# Altium project Bento Pad V1.0.PrjPcb (part 2 of 2)

## Sheet Controller_Sheet.SchDoc
size A4; SheetNumber: 2; SheetTotal: 3
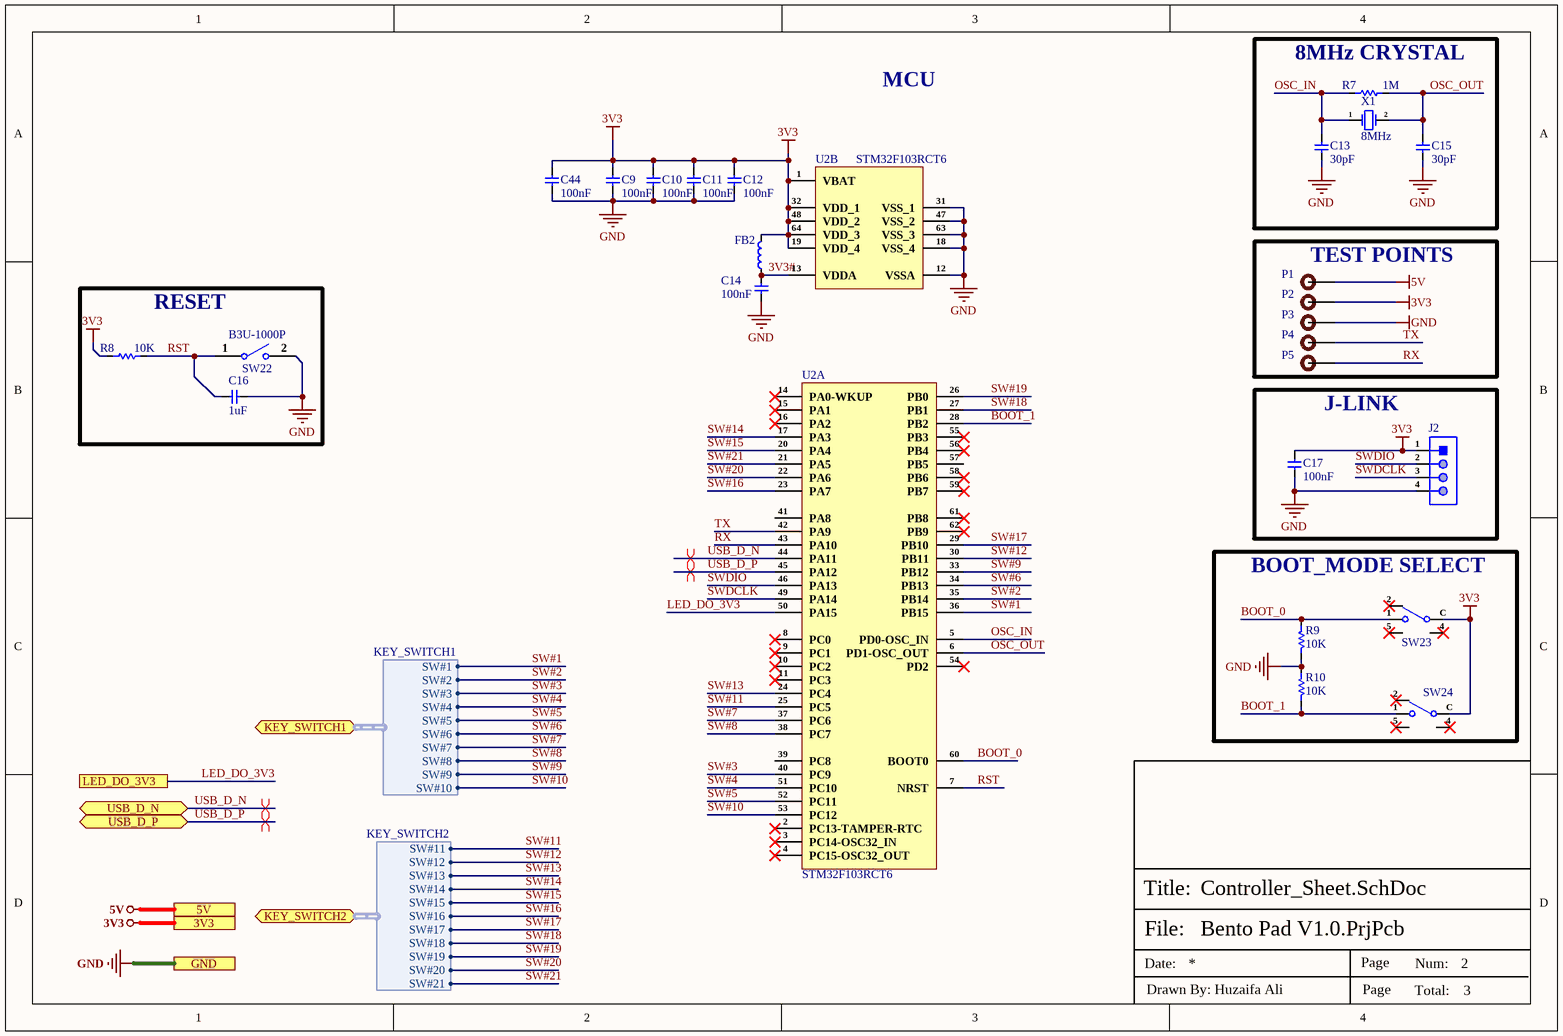
[diagram p1: Controller_Sheet.SchDoc]

### Parts
C9  100nF  [cap-0402]
C10  100nF  [cap-0402]
C11  100nF  [cap-0402]
C12  100nF  [cap-0402]
C13  30pF  [Cap-0402]
C14  100nF  [cap-0402]
C15  30pF  [Cap-0402]
C16  1uF  [Cap-0402]
C17  100nF  [cap-0402]
C44  100nF  [cap-0402]
FB2  MMZ2012R102ATD25  [Ind-0805]  (value not drawn)
J2  X6511WV-04H-C60D30  [HDR1X4_]  (value not drawn)
P1  TEST POINT  [Test-point]  (value not drawn)
P2  TEST POINT  [Test-point]  (value not drawn)
P3  TEST POINT  [Test-point]  (value not drawn)
P4  TEST POINT  [Test-point]  (value not drawn)
P5  TEST POINT  [Test-point]  (value not drawn)
R7  1M  [Res-0402]
R8  10K  [Res-0402]
R9  10K  [Res-0402]
R10  10K  [Res-0402]
SW22  B3U-1000P  [B3U-1000P]
SW23  MK-11C04-G013  [MK-11C04-G013]  (value not drawn)
SW24  MK-11C04-G013  [MK-11C04-G013]  (value not drawn)
U2  STM32F103RCT6  [64-LQFP (10x10)]  (parts A,B of 2)
X1  8MHz  [HC-49S-SMD]

### Blocks framed on the sheet
8MHz CRYSTAL: C13 C15 R7 X1
TEST POINTS: P1-P5
RESET: C16 R8 SW22
J-LINK: C17 J2
BOOT_MODE SELECT: R9 R10 SW23 SW24

### Ports
3V3, 5V, GND, KEY_SWITCH1 (bidir, harness KEY_SWITCH1), KEY_SWITCH2 (bidir, harness KEY_SWITCH2), LED_DO_3V3, USB_D_N (bidir), USB_D_P (bidir)

### Harnesses
KEY_SWITCH2: SW#11, SW#12, SW#13, SW#14, SW#15, SW#16, SW#17, SW#18, SW#19, SW#20, SW#21
KEY_SWITCH1: SW#1, SW#2, SW#3, SW#4, SW#5, SW#6, SW#7, SW#8, SW#9, SW#10

### Nets
3V3: C9.1 C10.1 C11.1 C12.1 C17.2 C44.1 FB2.2 J2.1 P2.1 R8.2 SW23.C SW24.C U2.1(VBAT) U2.19(VDD_4) U2.32(VDD_1) U2.48(VDD_2) U2.64(VDD_3) ; port 3V3
5V: P1.1 ; port 5V
GND: C9.2 C10.2 C11.2 C12.2 C13.1 C14.2 C15.1 C16.2 C17.1 C44.2 J2.4 P3.1 R9.2 R10.1 SW22.2 U2.12(VSSA) U2.18(VSS_4) U2.31(VSS_1) U2.47(VSS_2) U2.63(VSS_3) ; port GND
3V3#: C14.1 FB2.1 U2.13(VDDA)
BOOT_0: R9.1 SW23.1 U2.60(BOOT0)
BOOT_1: R10.2 SW24.1 U2.28(PB2)
LED_DO_3V3: U2.50(PA15) ; port LED_DO_3V3
OSC_IN: C13.2 R7.1 U2.5(PD0-OSC_IN) X1.1(OSC1)
OSC_OUT: C15.2 R7.2 U2.6(PD1-OSC_OUT) X1.2(OSC2)
RST: C16.1 R8.1 SW22.1 U2.7(NRST)
RX: P5.1 U2.43(PA10)
SW#1: U2.36(PB15) ; port KEY_SWITCH1.SW#1
SW#2: U2.35(PB14) ; port KEY_SWITCH1.SW#2
SW#3: U2.40(PC9) ; port KEY_SWITCH1.SW#3
SW#4: U2.51(PC10) ; port KEY_SWITCH1.SW#4
SW#5: U2.52(PC11) ; port KEY_SWITCH1.SW#5
SW#6: U2.34(PB13) ; port KEY_SWITCH1.SW#6
SW#7: U2.37(PC6) ; port KEY_SWITCH1.SW#7
SW#8: U2.38(PC7) ; port KEY_SWITCH1.SW#8
SW#9: U2.33(PB12) ; port KEY_SWITCH1.SW#9
SW#10: U2.53(PC12) ; port KEY_SWITCH1.SW#10
SW#11: U2.25(PC5) ; port KEY_SWITCH2.SW#11
SW#12: U2.30(PB11) ; port KEY_SWITCH2.SW#12
SW#13: U2.24(PC4) ; port KEY_SWITCH2.SW#13
SW#14: U2.17(PA3) ; port KEY_SWITCH2.SW#14
SW#15: U2.20(PA4) ; port KEY_SWITCH2.SW#15
SW#16: U2.23(PA7) ; port KEY_SWITCH2.SW#16
SW#17: U2.29(PB10) ; port KEY_SWITCH2.SW#17
SW#18: U2.27(PB1) ; port KEY_SWITCH2.SW#18
SW#19: U2.26(PB0) ; port KEY_SWITCH2.SW#19
SW#20: U2.22(PA6) ; port KEY_SWITCH2.SW#20
SW#21: U2.21(PA5) ; port KEY_SWITCH2.SW#21
SWDCLK: J2.3 U2.49(PA14)
SWDIO: J2.2 U2.46(PA13)
TX: P4.1 U2.42(PA9)
USB_D_N: U2.44(PA11) ; port USB_D_N
USB_D_P: U2.45(PA12) ; port USB_D_P

Not connected (* = marked no-connect by the designer): SW23 2* 4(MP)* 5(MP)*; SW24 2* 4(MP)* 5(MP)*; U2 2(PC13-TAMPER-RTC)* 3(PC14-OSC32_IN)* 4(PC15-OSC32_OUT)* 8(PC0)* 9(PC1)* 10(PC2)* 11(PC3)* 14(PA0-WKUP)* 15(PA1)* 16(PA2)* 39(PC8) 41(PA8) 54(PD2)* 55(PB3)* 56(PB4)* 57(PB5) 58(PB6)* 59(PB7)* 61(PB8)* 62(PB9)*

### Layout directives
differential pair; net class USB; differential pair class USB_Lines; rule Impedance Constraint [Min = 85.00    Max = 90.00    ]; rule Matched Net Lengths [Tolerance = 50mil]: USB_D_N, USB_D_P

### Notes on the sheet
- MCU
- File:
- Title:
- Date:
- Page
- Num:
- Total:
- Drawn By: Huzaifa Ali

### Library data of the parts
C9-C12 C14 C17 C44 = C1005X7R1H104KT000F: CAP CER 0.1UF 50V X7R 0402; Manufacturer: TDK; Tolerance: 10%; Voltage: 25V; Item Type: Capacitor; Supplier 1: Avnet; Manufacturer Part Number: C1005X7R1H104KT000F; RoHS: No; Category: Ceramic Capacitors; Dielectric: X7R; Supplier Part Number 1: C1005X7R1H104KT000F; LCSC Part Number: C361198; ComponentLink1Description: LCSC; ComponentLink1URL: https://www.lcsc.com/product-detail/Multilayer-Ceramic-Capacitors-MLCC-SMD-SMT_TDK-C1005X7R1H104KT000F_C361198.html
C13 C15 = CC0402GRNPO9BN300: CAP CER 30PF 50V C0G/NPO 0402; Manufacturer: Yageo; Item Type: Capacitor; Tolerance: 2%; Dielectric: C0G; Supplier: Digikey; LCSC Part Number: C277479; Manufacturer Part Number: CC0402GRNPO9BN300; RoHS: Yes; Stock: 114930; Pricing: 1=0.1, 10=0.052, 50=0.0296, 100=0.023, 500=0.01728, 1000=0.01358, 2500=0.01235, 5000=0.01136 (USD); Mounting Technology: Surface Mount; Case/Package: 0402; Case Code (Imperial): 0402; Case Code (Metric): 1005; Weight: 2.3E-05oz; Min Operating Temperature: -55°C; Max Operating Temperature: 125°C; Value: 30pF; Voltage Rating (DC): 50V; Packaging: Tape and Reel; Termination: SMD/SMT; Voltage Rating: 50V; Series: CC; Length: 0.039inch; Width: 0.02inch; Thickness: 0.022inch; Halogen Free: 5694HalogenFree; Lead Free: 5697LeadFree; ComponentLink1URL: https://datasheet.ciiva.com/13263/upy-gp-np0-16v-to-50v-8-3714-13263350.pdf?src-supplier=Mouser; ComponentLink1Description: https://datasheet.ciiva.com/13263/upy-gp-np0-16v-to-50v-8-3714-13263350.pdf?src-supplier=Mouser
C16 = C1005X5R1V105K050BC: CAP CER 1UF 35V X5R 0402; Manufacturer: TDK; Item Type: Capacitors; Dielectric Material: Ceramic; Material: 4241ConductorMaterial; Tolerance: 10%; Supplier: Digikey; Supplier Part Number: 445-9073-1-ND; Manufacturer Part Number: C1005X5R1V105K050BC; RoHS: Yes; Stock: 682645; Pricing: 1=0.15, 10=0.087, 50=0.061, 100=0.0528, 500=0.03898, 1000=0.03468, 2500=0.03011, 5000=0.02735 (USD); Mounting Technology: Surface Mount; Case/Package: 0402; Case Code (Metric): 1005; Case Code (Imperial): 0402; Min Operating Temperature: -55°C; Max Operating Temperature: 85°C; Value: 1uF; Voltage Rating: 35V; Packaging: Tape and Reel; Dielectric: X5R; Series: C; Length: 1mm; Depth: 0.5mm; Radiation Hardening: No; Reach SVHC Compliant: No; Lead Free: Lead Free; RoHS Compliant: Yes; ComponentLink1URL: https://datasheet.ciiva.com/26834/getdatasheetpartid-750449-26834298.pdf?src-supplier=Verical; ComponentLink1Description: https://datasheet.ciiva.com/26834/getdatasheetpartid-750449-26834298.pdf?src-supplier=Verical; ComponentLink2URL: https://datasheet.ciiva.com/28451/1796654-28451087.pdf?src-supplier=Element14; ComponentLink2Description: https://datasheet.ciiva.com/28451/1796654-28451087.pdf?src-supplier=Element14; ComponentLink3URL: https://datasheet.ciiva.com/22719/1796654-22719533.pdf?src-supplier=Element14; ComponentLink3Description: https://datasheet.ciiva.com/22719/1796654-22719533.pdf?src-supplier=Element14
FB2 = MMZ2012R102ATD25: FERRITE BEAD 1K OHM 0805 1LN; Manufacturer: TDK; Number of Lines: 1; Max Current Rating: 500mA; DC Resistance (DCR): 300mR; Impedance: 1kR; Tolerance: 25%; Test Frequency: 100MHz; Supplier 1: Digi-Key; Manufacturer Part Number: MMZ2012R102ATD25; RoHS: Yes; Category: Ferrite Beads and Chips; Stock 1: 2942; Pricing 1: 1=0.11000, 10=0.09200, 25=0.08280, 50=0.06080, 100=0.05240, 250=0.04140, 500=0.03496, 1000=0.02944 (USD); Mount: Surface Mount; Case/Package: 0805; Case Code (Metric): 2012; Case Code (Imperial): 0805; Weight: 0.000194oz; Min Operating Temperature: -55°C; Max Operating Temperature: 125°C; Package Quantity: 4000; Packaging: Tape and Reel; Termination: SMD/SMT; Max DC Current: 500mA; Length: 0.079inch; Width: 0.049inch; Height: 0.041inch; Ratings: AEC-Q200; RoHS Compliant: Yes; ComponentLink1URL: http://www.mouser.com/ds/2/400/beads_automotive_signal_mmz_en-469244.pdf?src-supplier=Mouser; ComponentLink1Description: http://www.mouser.com/ds/2/400/beads_automotive_signal_mmz_en-469244.pdf?src-supplier=Mouser; ComponentLink2URL: https://product.tdk.com/info/en/catalog/datasheets/beads_automotive_signal_mmz2012_en.pdf?src-supplier=Digi-Key; ComponentLink2Description: https://product.tdk.com/info/en/catalog/datasheets/beads_automotive_signal_mmz2012_en.pdf?src-supplier=Digi-Key; Supplier Part Number 1: 445-MMZ2012R102ATD25CT-ND; LCSC Part Number: C307765; Item Type: Ferrite Bead
J2 = X6511WV-04H-C60D30: Gold 250V 3A Straight Square Pins 2.5mm 4P 260℃ 6mm -40℃~+105℃ 3mm 2.54mm Plugin Black Brass 1x4P Plugin,P=2.54mm Pin Headers ROHS; Manufacturer: XKB; Item Type: Male Header; ComponentLink1Description: LCSC; ComponentLink1URL: https://www.lcsc.com/product-detail/Pin-Headers_XKB-Connectivity-X6511WV-04H-C60D30_C706876.html; Manufacturer Part Number: X6511WV-04H-C60D30; Package: Plugin,P=2.54mm; LCSC Part Number: C706876
P1-P5 = TEST POINT: Test Point ON; Item Type: TEST POINT
R7 = RC0402FR-071ML: RES 1M OHM 1% 1/16W 0402; Manufacturer: Yageo; Value: 1MR; Power Rating: 63mW; Voltage Rating: 50V; Temperature Coefficient: 100ppm/°C; Item Type: Resistor; Supplier: Digikey; Supplier Part Number: 311-1.00MLRCT-ND; Manufacturer Part Number: RC0402FR-071ML; RoHS: Yes; Category: Chip SMD Resistors; Stock: 6516; Pricing: 1=0.1, 10=0.015, 50=0.0088, 100=0.0073, 500=0.00488, 1000=0.00417, 5000=0.00297 (USD); Case/Package: 0402; Case Code (Imperial): 0402; Case Code (Metric): 1005; Min Operating Temperature: -55°C; Max Operating Temperature: 155°C; Resistor Type: Thick Film; Packaging: Tape and Reel; Tolerance: 1%; Termination: SMD/SMT; Features: Moisture Resistant; Series: RC; Max Power Dissipation: 63mW; Number of Terminations: 2; Resistance Tolerance: 1%; Construction: Rectangular; Technology: THICK FILM; Voltage Rating (AC): 50V; Length: 1mm; Height: 0.32mm; Depth: 0.5mm; RoHS Compliant: Yes; Military Standard: Not; Reach SVHC Compliant: Unknown; Lead Free: 5697LeadFree; ComponentLink1URL: https://datasheet.ciiva.com/11808/0900766b80c66297-11808125.pdf?src-supplier=Rs; ComponentLink1Description: https://datasheet.ciiva.com/11808/0900766b80c66297-11808125.pdf?src-supplier=Rs; ComponentLink2URL: https://datasheet.ciiva.com/46394/1018594-46394951.pdf?src-supplier=Element14; ComponentLink2Description: https://datasheet.ciiva.com/46394/1018594-46394951.pdf?src-supplier=Element14; ComponentLink3URL: https://datasheet.ciiva.com/7849/1018594-7849883.pdf?src-supplier=Element14; ComponentLink3Description: https://datasheet.ciiva.com/7849/1018594-7849883.pdf?src-supplier=Element14; ComponentLink4URL: https://datasheet.ciiva.com/7849/1018594-7849882.pdf?src-supplier=Element14; ComponentLink4Description: https://datasheet.ciiva.com/7849/1018594-7849882.pdf?src-supplier=Element14; ComponentLink5URL: https://datasheet.ciiva.com/16741/pyu-rc0402-51-rohs-l-6-r-16741081.pdf?src-supplier=Future+Electronics; ComponentLink5Description: https://datasheet.ciiva.com/16741/pyu-rc0402-51-rohs-l-6-r-16741081.pdf?src-supplier=Future+Electronics; LCSC Part Number: C138033
R8-R10 = RC0402FR-0710KL: RES 10K OHM 1% 1/16W 0402; Manufacturer: Yageo; Resistance: 10kR; Voltage Rating (DC): 50V; Temperature Coefficient: 100ppm/°C; Power Rating: 62.5mW; Max Power Dissipation: 63mW; Item Type: Resistor; Supplier 1: Mouser; Manufacturer Part Number: RC0402FR-0710KL; RoHS: Yes; Category: Chip SMD Resistors; Stock 1: 18648329; Pricing 1: 1=0.10000, 10=0.01400, 50=0.01400, 100=0.00500, 1000=0.00300, 10000=0.00200 (USD); Case/Package: 0402; Number of Pins: 2; Case Code (Imperial): 0402; Case Code (Metric): 1005; Min Operating Temperature: -55°C; Max Operating Temperature: 155°C; Resistor Type: Thick Film; Tolerance: 1%; Packaging: Tape and Reel; Voltage Rating: 50V; Termination: SMD/SMT; Working Voltage: 50V; Number of Terminations: 2; Features: Moisture Resistant; Series: RC; Resistance Tolerance: 1%; Construction: Rectangular; Length: 1mm; Width: 0.5mm; Height: 0.32mm; Depth: 0.5mm; Lead Pitch: 0.2mm; REACH SVHC: No SVHC; Lead Free: Lead Free; RoHS Compliant: Yes; Military Standard: Not; ComponentLink1URL: https://datasheet.ciiva.com/7660/38568-7660787.pdf?src-supplier=Element14; ComponentLink1Description: https://datasheet.ciiva.com/7660/38568-7660787.pdf?src-supplier=Element14; ComponentLink2URL: https://datasheet.ciiva.com/7849/1686128-7849814.pdf?src-supplier=Element14; ComponentLink2Description: https://datasheet.ciiva.com/7849/1686128-7849814.pdf?src-supplier=Element14; ComponentLink3URL: https://datasheet.ciiva.com/7983/1018594-7983486.pdf?src-supplier=Element14; ComponentLink3Description: https://datasheet.ciiva.com/7983/1018594-7983486.pdf?src-supplier=Element14; ComponentLink4URL: https://datasheet.ciiva.com/22747/1018594-22747512.pdf?src-supplier=Element14; ComponentLink4Description: https://datasheet.ciiva.com/22747/1018594-22747512.pdf?src-supplier=Element14; ComponentLink5URL: https://datasheet.ciiva.com/12667/pyu-rc0402-51-rohs-l-6-r-12667067.pdf?src-supplier=Mouser; ComponentLink5Description: https://datasheet.ciiva.com/12667/pyu-rc0402-51-rohs-l-6-r-12667067.pdf?src-supplier=Mouser; ComponentLink6URL: https://datasheet.ciiva.com/7849/1784430-7849813.pdf?src-supplier=Element14; ComponentLink6Description: https://datasheet.ciiva.com/7849/1784430-7849813.pdf?src-supplier=Element14; ComponentLink7URL: https://datasheet.ciiva.com/7849/1784430-7849815.pdf?src-supplier=Element14; ComponentLink7Description: https://datasheet.ciiva.com/7849/1784430-7849815.pdf?src-supplier=Element14; Supplier Part Number 1: 603-RC0402FR-0710KL; LCSC Part Number: C60490
SW22 = B3U-1000P: SWITCH TACTILE SPST-NO 0.05A 12V; Manufacturer: Omron; Mechanical Life: 200000Cycles; Operating Force: 1.5N; Throw Configuration: SPST; Current Rating: 50mA; Contact Resistance: 100mR; Illumination Type: Non-Illuminated,Illuminated; Switch Travel: 0.15mm; Switch Function: Off-Mom; Actuator Type: Standard; Actuator Length: 0.4mm; Ratings: Dust Proof,IP40; ComponentLink1URL: http://www.farnell.com/datasheets/60838.pdf?src-supplier=Farnell; ComponentLink1Description: http://www.farnell.com/datasheets/60838.pdf?src-supplier=Farnell; ComponentLink2URL: http://www.farnell.com/datasheets/60838.pdf?src-supplier=Element14; ComponentLink2Description: http://www.farnell.com/datasheets/60838.pdf?src-supplier=Element14; ComponentLink3URL: https://omronfs.omron.com/en_US/ecb/products/pdf/en-b3u.pdf?src-supplier=Digi-Key; ComponentLink3Description: https://omronfs.omron.com/en_US/ecb/products/pdf/en-b3u.pdf?src-supplier=Digi-Key; ComponentLink4URL: http://www.omron.com/ecb/products/pdf/en-b3u.pdf?src-supplier=Digi-Key; ComponentLink4Description: http://www.omron.com/ecb/products/pdf/en-b3u.pdf?src-supplier=Digi-Key; ComponentLink5URL: https://www.distrelec.biz/Web/Downloads/he/et/B3U_eng_datasheet.pdf?mime=application%2Fpdf&src-supplier=Distrelec; ComponentLink5Description: https://www.distrelec.biz/Web/Downloads/he/et/B3U_eng_datasheet.pdf?mime=application%2Fpdf&src-supplier=Distrelec; ComponentLink6URL: http://www.onlinecomponents.com/productFiles/mf-OM/en-b3u.pdf?src-supplier=Onlinecomponents.com; ComponentLink6Description: http://www.onlinecomponents.com/productFiles/mf-OM/en-b3u.pdf?src-supplier=Onlinecomponents.com; Supplier 1: Digi-Key; Manufacturer Part Number: B3U-1000P; Stock 1: 116454; Pricing 1: 1=1, 10=0.961, 25=0.9064, 50=0.7976, 100=0.7251, 250=0.68888, 500=0.67074, 1000=0.52571 (USD); Mount: Surface Mount; Weight: 0.000776oz; Contact Material: Silver; Min Operating Temperature: -25°C; Max Operating Temperature: 70°C; Packaging: Tape and Reel; Voltage Rating (DC): 12V; Package Quantity: 1; Max Current Rating: 50mA; Termination: SMD/SMT; Orientation: Straight; Max Voltage Rating (DC): 12V; Electrical Life: 200000Cycles; Insulation Resistance: 100MR; Contact Current Rating: 50mA; Length: 4mm; Height: 1.2mm; Depth: 2.5mm; Width: 3mm; REACH SVHC: Unknown; Lead Free: Lead Free; ComponentLink7URL: https://www.verical.com/server-webapp/html/getDatasheet?partID=552554&src-supplier=Verical; ComponentLink7Description: https://www.verical.com/server-webapp/html/getDatasheet?partID=552554&src-supplier=Verical; ComponentLink8URL: http://www.farnell.com/datasheets/1685550.pdf?src-supplier=Element14; ComponentLink8Description: http://www.farnell.com/datasheets/1685550.pdf?src-supplier=Element14; ComponentLink9URL: http://www.farnell.com/datasheets/2610940.pdf?src-supplier=Farnell; ComponentLink9Description: http://www.farnell.com/datasheets/2610940.pdf?src-supplier=Farnell; ComponentLink10URL: https://www.alliedelec.com/m/d/4c8a9ef82804fc3c241a13c1e298fd73.pdf?src-supplier=Allied+Electronics; ComponentLink10Description: https://www.alliedelec.com/m/d/4c8a9ef82804fc3c241a13c1e298fd73.pdf?src-supplier=Allied+Electronics; Supplier Part Number 1: SW1020DKR-ND; LCSC Part Number: C231329; Item Type: Switch
SW23 SW24 = MK-11C04-G013: Surface Mount 1A SPDT 6V Black 10000次 SMD Slide Switches ROHS; Manufacturer: G-Switch; Manufacturer Part Number: MK-11C04-G013; Package: SMD; LCSC Part Number: C778185; Item Type: Slide Switche; ComponentLink1Description: LCSC; ComponentLink1URL: https://www.lcsc.com/product-detail/Slide-Switches_G-Switch-MK-11C04-G013_C778185.html
U2 = STM32F103RCT6: IC MCU 32BIT 256KB FLASH 64LQFP; Manufacturer: STMicroelectronics; Interface: I2C,SPI,USB,CAN,USART; RAM Size: 48KB; Max Supply Voltage: 3.6V; Number of I/Os: 51; Number of Timers/Counters: 8; Min Supply Voltage: 2V; Data Bus Width: 32b; Clock Frequency: 72MHz; Core Architecture: ARM; Number of ADC Channels: 16; Supplier 1: Mouser; Manufacturer Part Number: STM32F103RCT6; RoHS: Yes; Category: Microcontrollers; Stock 1: 44788; Pricing 1: 1=9.74000, 10=8.79000, 50=8.38000, 100=7.28000, 1000=5.58000, 10000=5.58000 (USD); Case/Package: LQFP; Pins: 64; Weight: 0.012088oz; Min Operating Temperature: -40°C; Max Operating Temperature: 85°C; Package Quantity: 960; Packaging: Tray; Memory Format: FLASH; Memory Size: 256KB; Series: STM32F103RC; Length: 10mm; Width: 10mm; Height: 1.4mm; Lead Free: Lead Free; RoHS Compliant: Yes; ComponentLink1URL: https://datasheet.ciiva.com/4845/cd00191185-4845648.pdf?src-supplier=Mouser; ComponentLink1Description: https://datasheet.ciiva.com/4845/cd00191185-4845648.pdf?src-supplier=Mouser; ComponentLink2URL: https://datasheet.ciiva.com/8054/1831497-8054949.pdf?src-supplier=Element14; ComponentLink2Description: https://datasheet.ciiva.com/8054/1831497-8054949.pdf?src-supplier=Element14; ComponentLink3URL: https://datasheet.ciiva.com/5752/cd00191185-5752853.pdf?src-supplier=Farnell; ComponentLink3Description: https://datasheet.ciiva.com/5752/cd00191185-5752853.pdf?src-supplier=Farnell; ComponentLink4URL: https://datasheet.ciiva.com/9224/cd00191185-9224408.pdf?src-supplier=Avnet; ComponentLink4Description: https://datasheet.ciiva.com/9224/cd00191185-9224408.pdf?src-supplier=Avnet; ComponentLink5URL: https://datasheet.ciiva.com/16382/cd00191185-16382444.pdf?src-supplier=Future+Electronics; ComponentLink5Description: https://datasheet.ciiva.com/16382/cd00191185-16382444.pdf?src-supplier=Future+Electronics; Supplier Part Number 1: 511-STM32F103RCT6; LCSC Part Number: C8323; Item Type: IC
X1 = TAXM8M2GLFBET2T: 8MHz Surface Mount Crystal 20pF ±30ppm ±30ppm HC-49S-SMD Crystals ROHS; Manufacturer: Yajingxin; Manufacturer Part Number: TAXM8M2GLFBET2T; Package: HC-49S-SMD; LCSC Part Number: C107426; Item Type: Crystal; ComponentLink1Description: LCSC; ComponentLink1URL: https://www.lcsc.com/product-detail/SMD-Crystal-Resonators_TAE-Zhejiang-Abel-Elec-HC-49SM8MHz20pF30ppm_C107426.html

## Sheet Button_Sheet.SchDoc
size 420 x 297 mm; SheetNumber: 3; SheetTotal: 3
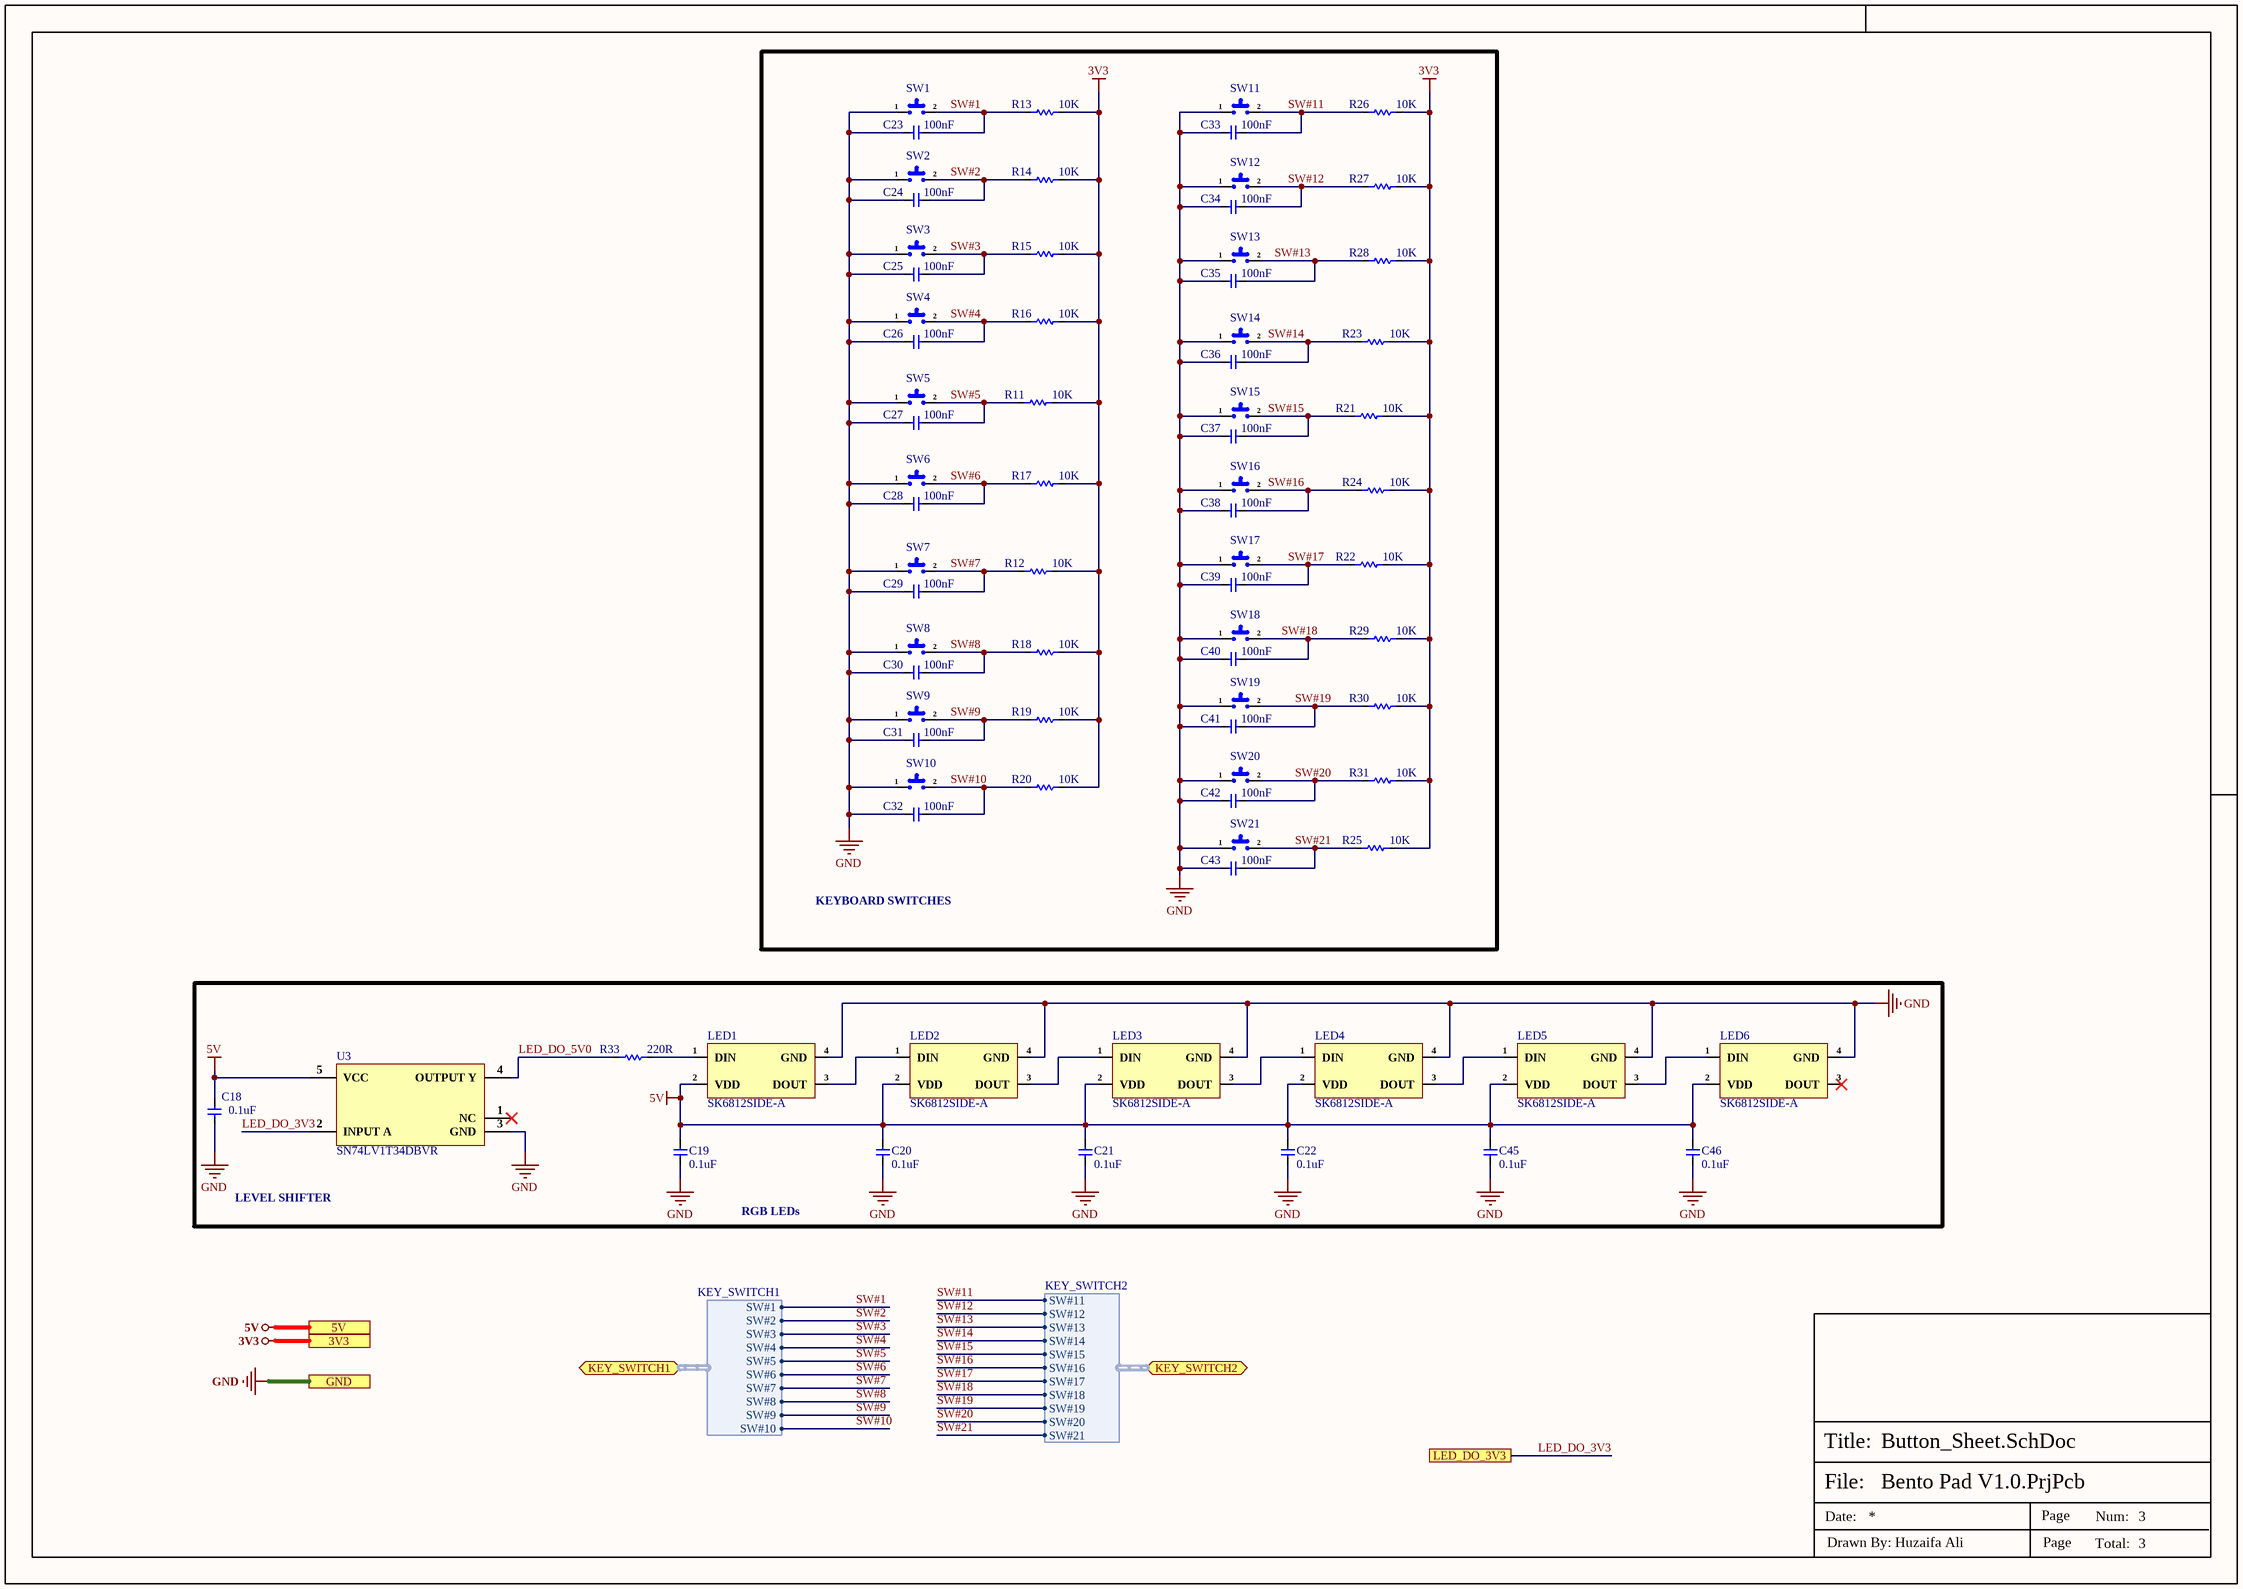
[diagram p2: Button_Sheet.SchDoc]

### Parts
C18  0.1uF  [Cap-0402]
C19  0.1uF  [Cap-0402]
C20  0.1uF  [Cap-0402]
C21  0.1uF  [Cap-0402]
C22  0.1uF  [Cap-0402]
C23  100nF  [cap-0402]
C24  100nF  [cap-0402]
C25  100nF  [cap-0402]
C26  100nF  [cap-0402]
C27  100nF  [cap-0402]
C28  100nF  [cap-0402]
C29  100nF  [cap-0402]
C30  100nF  [cap-0402]
C31  100nF  [cap-0402]
C32  100nF  [cap-0402]
C33  100nF  [cap-0402]
C34  100nF  [cap-0402]
C35  100nF  [cap-0402]
C36  100nF  [cap-0402]
C37  100nF  [cap-0402]
C38  100nF  [cap-0402]
C39  100nF  [cap-0402]
C40  100nF  [cap-0402]
C41  100nF  [cap-0402]
C42  100nF  [cap-0402]
C43  100nF  [cap-0402]
C45  0.1uF  [Cap-0402]
C46  0.1uF  [Cap-0402]
LED1  SK6812SIDE-A  [SK6812SIDE-A]
LED2  SK6812SIDE-A  [SK6812SIDE-A]
LED3  SK6812SIDE-A  [SK6812SIDE-A]
LED4  SK6812SIDE-A  [SK6812SIDE-A]
LED5  SK6812SIDE-A  [SK6812SIDE-A]
LED6  SK6812SIDE-A  [SK6812SIDE-A]
R11  10K  [Res-0402]
R12  10K  [Res-0402]
R13  10K  [Res-0402]
R14  10K  [Res-0402]
R15  10K  [Res-0402]
R16  10K  [Res-0402]
R17  10K  [Res-0402]
R18  10K  [Res-0402]
R19  10K  [Res-0402]
R20  10K  [Res-0402]
R21  10K  [Res-0402]
R22  10K  [Res-0402]
R23  10K  [Res-0402]
R24  10K  [Res-0402]
R25  10K  [Res-0402]
R26  10K  [Res-0402]
R27  10K  [Res-0402]
R28  10K  [Res-0402]
R29  10K  [Res-0402]
R30  10K  [Res-0402]
R31  10K  [Res-0402]
R33  220R  [Res-0603]
SW1  CPG151101S11-16  [CPG151101S11-16]  (value not drawn)
SW2  CPG151101S11-16  [CPG151101S11-16]  (value not drawn)
SW3  CPG151101S11-16  [CPG151101S11-16]  (value not drawn)
SW4  CPG151101S11-16  [CPG151101S11-16]  (value not drawn)
SW5  CPG151101S11-16  [CPG151101S11-16]  (value not drawn)
SW6  CPG151101S11-16  [CPG151101S11-16]  (value not drawn)
SW7  CPG151101S11-16  [CPG151101S11-16]  (value not drawn)
SW8  CPG151101S11-16  [CPG151101S11-16]  (value not drawn)
SW9  CPG151101S11-16  [CPG151101S11-16]  (value not drawn)
SW10  CPG151101S11-16  [CPG151101S11-16]  (value not drawn)
SW11  CPG151101S11-16  [CPG151101S11-16]  (value not drawn)
SW12  CPG151101S11-16  [CPG151101S11-16]  (value not drawn)
SW13  CPG151101S11-16  [CPG151101S11-16]  (value not drawn)
SW14  CPG151101S11-16  [CPG151101S11-16]  (value not drawn)
SW15  CPG151101S11-16  [CPG151101S11-16]  (value not drawn)
SW16  CPG151101S11-16  [CPG151101S11-16]  (value not drawn)
SW17  CPG151101S11-16  [CPG151101S11-16]  (value not drawn)
SW18  CPG151101S11-16  [CPG151101S11-16]  (value not drawn)
SW19  CPG151101S11-16  [CPG151101S11-16]  (value not drawn)
SW20  CPG151101S11-16  [CPG151101S11-16]  (value not drawn)
SW21  CPG151101S11-16  [CPG151101S11-16]  (value not drawn)
U3  SN74LV1T34DBVR  [SOT-23-5]

### Blocks framed on the sheet
KEYBOARD SWITCHES: C23-C43 R11-R31 SW1-SW21

### Ports
3V3, 5V, GND, KEY_SWITCH1 (bidir, harness KEY_SWITCH1), KEY_SWITCH2 (bidir, harness KEY_SWITCH2), LED_DO_3V3

### Harnesses
KEY_SWITCH2: SW#11, SW#12, SW#13, SW#14, SW#15, SW#16, SW#17, SW#18, SW#19, SW#20, SW#21
KEY_SWITCH1: SW#1, SW#2, SW#3, SW#4, SW#5, SW#6, SW#7, SW#8, SW#9, SW#10

### Nets
3V3: R11.1 R12.1 R13.1 R14.1 R15.1 R16.1 R17.1 R18.1 R19.1 R20.1 R21.1 R22.1 R23.1 R24.1 R25.1 R26.1 R27.1 R28.1 R29.1 R30.1 R31.1 ; port 3V3
5V: C18.2 C19.2 C20.2 C21.2 C22.2 C45.2 C46.2 LED1.2(VDD) LED2.2(VDD) LED3.2(VDD) LED4.2(VDD) LED5.2(VDD) LED6.2(VDD) U3.5(VCC) ; port 5V
GND: C18.1 C19.1 C20.1 C21.1 C22.1 C23.1 C24.1 C25.1 C26.1 C27.1 C28.1 C29.1 C30.1 C31.1 C32.1 C33.1 C34.1 C35.1 C36.1 C37.1 C38.1 C39.1 C40.1 C41.1 C42.1 C43.1 C45.1 C46.1 LED1.4(GND) LED2.4(GND) LED3.4(GND) LED4.4(GND) LED5.4(GND) LED6.4(GND) SW1.1 SW2.1 SW3.1 SW4.1 SW5.1 SW6.1 SW7.1 SW8.1 SW9.1 SW10.1 SW11.1 SW12.1 SW13.1 SW14.1 SW15.1 SW16.1 SW17.1 SW18.1 SW19.1 SW20.1 SW21.1 U3.3(GND) ; port GND
LED_DO_3V3: U3.2(INPUT_A) ; port LED_DO_3V3
LED_DO_5V0: R33.1 U3.4(OUTPUT_Y)
SW#1: C23.2 R13.2 SW1.2 ; port KEY_SWITCH1.SW#1
SW#2: C24.2 R14.2 SW2.2 ; port KEY_SWITCH1.SW#2
SW#3: C25.2 R15.2 SW3.2 ; port KEY_SWITCH1.SW#3
SW#4: C26.2 R16.2 SW4.2 ; port KEY_SWITCH1.SW#4
SW#5: C27.2 R11.2 SW5.2 ; port KEY_SWITCH1.SW#5
SW#6: C28.2 R17.2 SW6.2 ; port KEY_SWITCH1.SW#6
SW#7: C29.2 R12.2 SW7.2 ; port KEY_SWITCH1.SW#7
SW#8: C30.2 R18.2 SW8.2 ; port KEY_SWITCH1.SW#8
SW#9: C31.2 R19.2 SW9.2 ; port KEY_SWITCH1.SW#9
SW#10: C32.2 R20.2 SW10.2 ; port KEY_SWITCH1.SW#10
SW#11: C33.2 R26.2 SW11.2 ; port KEY_SWITCH2.SW#11
SW#12: C34.2 R27.2 SW12.2 ; port KEY_SWITCH2.SW#12
SW#13: C35.2 R28.2 SW13.2 ; port KEY_SWITCH2.SW#13
SW#14: C36.2 R23.2 SW14.2 ; port KEY_SWITCH2.SW#14
SW#15: C37.2 R21.2 SW15.2 ; port KEY_SWITCH2.SW#15
SW#16: C38.2 R24.2 SW16.2 ; port KEY_SWITCH2.SW#16
SW#17: C39.2 R22.2 SW17.2 ; port KEY_SWITCH2.SW#17
SW#18: C40.2 R29.2 SW18.2 ; port KEY_SWITCH2.SW#18
SW#19: C41.2 R30.2 SW19.2 ; port KEY_SWITCH2.SW#19
SW#20: C42.2 R31.2 SW20.2 ; port KEY_SWITCH2.SW#20
SW#21: C43.2 R25.2 SW21.2 ; port KEY_SWITCH2.SW#21
NetLED1_1: LED1.1(DIN) R33.2
NetLED1_3: LED1.3(DOUT) LED2.1(DIN)
NetLED2_3: LED2.3(DOUT) LED3.1(DIN)
NetLED3_3: LED3.3(DOUT) LED4.1(DIN)
NetLED4_3: LED4.3(DOUT) LED5.1(DIN)
NetLED5_3: LED5.3(DOUT) LED6.1(DIN)

Not connected (* = marked no-connect by the designer): LED6 3(DOUT)*; U3 1(NC)*

### Notes on the sheet
- LEVEL SHIFTER
- RGB LEDs
- File:
- Title:
- Date:
- Page
- Num:
- Total:
- Drawn By: Huzaifa Ali

### Library data of the parts
C18-C22 C45 C46 = GRM155R71E104KE14D: CAP CER 0.1UF 25V X7R 0402; Manufacturer: Murata; Item Type: Capacitors; Dielectric Material: Ceramic; Material: 4241ConductorMaterial; Value: 100nF; Tolerance: 10%; Supplier: Mouser; LCSC Part Number: C77014; Manufacturer Part Number: GRM155R71E104KE14D; RoHS: Yes; Stock: 652368; Pricing: 1=0.1, 10=0.007, 50=0.007, 100=0.005, 1000=0.005, 10000=0.004 (USD); Mounting Technology: Surface Mount; Case/Package: 0402; Pins: 2NUMBER; Case Code (Metric): 1005; Case Code (Imperial): 0402; Weight: 0.000212oz; Min Operating Temperature: -55°C; Max Operating Temperature: 125°C; Packaging: Tape and Reel; Voltage Rating: 25V; Dielectric: X7R; Voltage: 25V; Termination: SMD/SMT; Voltage Rating (DC): 25V; Package Quantity: 10000; Series: GRM; Length: 1mm; Width: 0.02inch; Height: 0.5mm; Thickness: 0.022inch; Depth: 0.5mm; RoHS Compliant: Yes; Reach SVHC Compliant: Unknown; Lead Free: 5697LeadFree; ComponentLink1URL: http://www.farnell.com/datasheets/1872206.pdf?src-supplier=Farnell; ComponentLink1Description: http://www.farnell.com/datasheets/1872206.pdf?src-supplier=Farnell; ComponentLink2URL: http://www.mouser.com/ds/2/281/c02e-2905.pdf?src-supplier=Mouser; ComponentLink2Description: http://www.mouser.com/ds/2/281/c02e-2905.pdf?src-supplier=Mouser; ComponentLink3URL: http://uk.rs-online.com/webdocs/144c/0900766b8144c113.pdf?src-supplier=Rs; ComponentLink3Description: http://uk.rs-online.com/webdocs/144c/0900766b8144c113.pdf?src-supplier=Rs; ComponentLink4URL: https://datasheet.octopart.com/GRM155R71E104KE14D-Murata-datasheet-62346597.pdf?src-supplier=Future+Electronics; ComponentLink4Description: https://datasheet.octopart.com/GRM155R71E104KE14D-Murata-datasheet-62346597.pdf?src-supplier=Future+Electronics; ComponentLink5URL: https://search.murata.co.jp/Ceramy/image/img/A01X/G101/ENG/GRM155R71E104KE14-01.pdf?src-supplier=Digikey; ComponentLink5Description: https://search.murata.co.jp/Ceramy/image/img/A01X/G101/ENG/GRM155R71E104KE14-01.pdf?src-supplier=Digikey; ComponentLink6URL: http://www.farnell.com/datasheets/2048008.pdf?src-supplier=Newark; ComponentLink6Description: http://www.farnell.com/datasheets/2048008.pdf?src-supplier=Newark; ComponentLink7URL: https://datasheet.octopart.com/GRM155R71E104KE14D-Murata-datasheet-62317124.pdf?src-supplier=Element14; ComponentLink7Description: https://datasheet.octopart.com/GRM155R71E104KE14D-Murata-datasheet-62317124.pdf?src-supplier=Element14; ComponentLink8URL: http://psearch.en.murata.com/capacitor/product/GRM155R71E104KE14%23.pdf?src-supplier=Avnet; ComponentLink8Description: http://psearch.en.murata.com/capacitor/product/GRM155R71E104KE14%23.pdf?src-supplier=Avnet
C23-C43 = C1005X7R1H104KT000F: as C9 on sheet Controller_Sheet; Supplier 1: Avnet; Manufacturer Part Number: C1005X7R1H104KT000F; RoHS: No; Category: Ceramic Capacitors; Dielectric: X7R; Supplier Part Number 1: C1005X7R1H104KT000F; LCSC Part Number: C361198; ComponentLink1Description: LCSC; ComponentLink1URL: https://www.lcsc.com/product-detail/Multilayer-Ceramic-Capacitors-MLCC-SMD-SMT_TDK-C1005X7R1H104KT000F_C361198.html
LED1-LED6 = SK6812SIDE-A: SMD-4P,1.6x4mm Light Emitting Diodes (LED) ROHS; Manufacturer: OPSCO Optoelectronics; Item type: Addressable RGB LED; ComponentLink1Description: LCSC; ComponentLink1URL: https://www.lcsc.com/product-detail/Light-Emitting-Diodes-LED_OPSCO-Optoelectronics-SK6812SIDE-A_C5378721.html; Manufacturer Part Number: SK6812SIDE-A; Package: SMD-4P,1.6x4mm; LCSC Part Number: C5378721
R11-R31 = RC0402FR-0710KL: as R8 on sheet Controller_Sheet; Supplier 1: Mouser; Manufacturer Part Number: RC0402FR-0710KL; RoHS: Yes; Category: Chip SMD Resistors; Stock 1: 18648329; Pricing 1: 1=0.10000, 10=0.01400, 50=0.01400, 100=0.00500, 1000=0.00300, 10000=0.00200 (USD); Case/Package: 0402; Number of Pins: 2; Case Code (Imperial): 0402; Case Code (Metric): 1005; Min Operating Temperature: -55°C; Max Operating Temperature: 155°C; Resistor Type: Thick Film; Tolerance: 1%; Packaging: Tape and Reel; Voltage Rating: 50V; Termination: SMD/SMT; Working Voltage: 50V; Number of Terminations: 2; Features: Moisture Resistant; Series: RC; Resistance Tolerance: 1%; Construction: Rectangular; Length: 1mm; Width: 0.5mm; Height: 0.32mm; Depth: 0.5mm; Lead Pitch: 0.2mm; REACH SVHC: No SVHC; Lead Free: Lead Free; RoHS Compliant: Yes; Military Standard: Not; ComponentLink1URL: https://datasheet.ciiva.com/7660/38568-7660787.pdf?src-supplier=Element14; ComponentLink1Description: https://datasheet.ciiva.com/7660/38568-7660787.pdf?src-supplier=Element14; ComponentLink2URL: https://datasheet.ciiva.com/7849/1686128-7849814.pdf?src-supplier=Element14; ComponentLink2Description: https://datasheet.ciiva.com/7849/1686128-7849814.pdf?src-supplier=Element14; ComponentLink3URL: https://datasheet.ciiva.com/7983/1018594-7983486.pdf?src-supplier=Element14; ComponentLink3Description: https://datasheet.ciiva.com/7983/1018594-7983486.pdf?src-supplier=Element14; ComponentLink4URL: https://datasheet.ciiva.com/22747/1018594-22747512.pdf?src-supplier=Element14; ComponentLink4Description: https://datasheet.ciiva.com/22747/1018594-22747512.pdf?src-supplier=Element14; ComponentLink5URL: https://datasheet.ciiva.com/12667/pyu-rc0402-51-rohs-l-6-r-12667067.pdf?src-supplier=Mouser; ComponentLink5Description: https://datasheet.ciiva.com/12667/pyu-rc0402-51-rohs-l-6-r-12667067.pdf?src-supplier=Mouser; ComponentLink6URL: https://datasheet.ciiva.com/7849/1784430-7849813.pdf?src-supplier=Element14; ComponentLink6Description: https://datasheet.ciiva.com/7849/1784430-7849813.pdf?src-supplier=Element14; ComponentLink7URL: https://datasheet.ciiva.com/7849/1784430-7849815.pdf?src-supplier=Element14; ComponentLink7Description: https://datasheet.ciiva.com/7849/1784430-7849815.pdf?src-supplier=Element14; Supplier Part Number 1: 603-RC0402FR-0710KL; LCSC Part Number: C60490
R33 = RC0603FR-07220RL: RES SMD 220 OHM 1% 1/10W 0603; Manufacturer: Yageo; Temperature Coefficient: 100ppm/°C; Voltage Rating (DC): 50V; Power Rating: 100mW; Item Type: Resistor; Supplier 1: Digi-Key; Manufacturer Part Number: RC0603FR-07220RL; Stock 1: 5843995; Pricing 1: 1=0.1, 10=0.023, 100=0.0094, 1000=0.00421, 2500=0.00366 (USD); Case/Package: 0603; Number of Pins: 2; Case Code (Imperial): 0603; Case Code (Metric): 1608; Min Operating Temperature: -55°C; Max Operating Temperature: 155°C; Resistance: 220R; Tolerance: 1%; Composition: Thick Film; Packaging: Tape and Reel; Voltage Rating: 50V; Package Quantity: 1; Termination: SMD/SMT; Number of Terminations: 2; Military Standard: Not; Max Power Dissipation: 100mW; Features: Moisture Resistant; Length: 1.6mm; Height: 0.022inch; Width: 0.031inch; Depth: 0.8mm; REACH SVHC: No SVHC; Lead Free: Lead Free; ComponentLink1URL: http://www.yageo.com/documents/recent/PYu-RC_Group_51_RoHS_L_10.pdf?src-supplier=Digi-Key; ComponentLink1Description: http://www.yageo.com/documents/recent/PYu-RC_Group_51_RoHS_L_10.pdf?src-supplier=Digi-Key; ComponentLink2URL: http://www.farnell.com/datasheets/1868787.pdf?src-supplier=Element14; ComponentLink2Description: http://www.farnell.com/datasheets/1868787.pdf?src-supplier=Element14; Supplier Part Number 1: 311-220HRCT-ND; LCSC Part Number: C107696
SW1-SW21 = CPG151101S11-16: SMD,14.5x5.9mm Mechanical Keyboard Shaft ROHS; Manufacturer: HanElectricity; Manufacturer Part Number: CPG151101S11-16; Package: SMD,14.5x5.9mm; LCSC Part Number: C41430893; Item Type: Mechanical Keyboard Shaft; ComponentLink1Description: LCSC; ComponentLink1URL: https://www.lcsc.com/product-detail/Mechanical-Keyboard-Shaft_HanElectricity-CPG151101S11-16_C41430893.html?s_z=n_%2520CPG151101S11-16
U3 = SN74LV1T34DBVR: IC BUF NON-INVERT 5.5V SOT23-5; Manufacturer: Texas Instruments; Number of Elements: 1; Logic Function: Buffer,Inverting; High Level Output Current: -8mA; Low Level Output Current: 8mA; Min Supply Voltage: 1.6V; Polarity: Non-Inverting; Propagation Delay: 15.5ns; Quiescent Current: 1uA; Supplier 1: Digi-Key; Manufacturer Part Number: SN74LV1T34DBVR; Stock 1: 37360; Pricing 1: 1=0.43, 10=0.349, 25=0.3192, 100=0.2374, 250=0.2152, 500=0.17808, 1000=0.13356 (USD); Mount: Surface Mount; Case/Package: SOT-23-5; Number of Pins: 5; Weight: 0.000353oz; Min Operating Temperature: -40°C; Max Operating Temperature: 125°C; Packaging: Tape and Reel; Number of Bits per Element: 1; Number of Bits: 1; Package Quantity: 3000; Max Supply Voltage: 5.5V; Number of Input Lines: 1; Number of Output Lines: 1; Operating Supply Current: 8mA; Number of Channels: 1; Number of Inputs: 1; Number of Outputs: 1; Radiation Hardening: No; RoHS Compliant: Yes; REACH SVHC: No SVHC; Lead Free: Lead Free; ComponentLink1URL: http://www.ti.com/lit/pdf/sdyu001?src-supplier=Digi-Key; ComponentLink1Description: http://www.ti.com/lit/pdf/sdyu001?src-supplier=Digi-Key; ComponentLink2URL: http://www.ti.com/lit/ds/symlink/sn74lv1t34.pdf?src-supplier=Avnet; ComponentLink2Description: http://www.ti.com/lit/ds/symlink/sn74lv1t34.pdf?src-supplier=Avnet; Supplier Part Number 1: 296-37176-6-ND; LCSC Part Number: C100024; Item Type: IC

## Nets that join several sheets
3V3: Power_Sheet (C8.2 U1.4), Controller_Sheet (17 pins), Button_Sheet (21 pins)
5V: Power_Sheet (6 pins), Controller_Sheet (P1.1), Button_Sheet (14 pins)
GND: Power_Sheet (18 pins), Controller_Sheet (20 pins), Button_Sheet (56 pins)
LED_DO_3V3: Controller_Sheet (U2.50), Button_Sheet (U3.2)
SW#1: Controller_Sheet (U2.36), Button_Sheet (C23.2 R13.2 SW1.2)
SW#2: Controller_Sheet (U2.35), Button_Sheet (C24.2 R14.2 SW2.2)
SW#3: Controller_Sheet (U2.40), Button_Sheet (C25.2 R15.2 SW3.2)
SW#4: Controller_Sheet (U2.51), Button_Sheet (C26.2 R16.2 SW4.2)
SW#5: Controller_Sheet (U2.52), Button_Sheet (C27.2 R11.2 SW5.2)
SW#6: Controller_Sheet (U2.34), Button_Sheet (C28.2 R17.2 SW6.2)
SW#7: Controller_Sheet (U2.37), Button_Sheet (C29.2 R12.2 SW7.2)
SW#8: Controller_Sheet (U2.38), Button_Sheet (C30.2 R18.2 SW8.2)
SW#9: Controller_Sheet (U2.33), Button_Sheet (C31.2 R19.2 SW9.2)
SW#10: Controller_Sheet (U2.53), Button_Sheet (C32.2 R20.2 SW10.2)
SW#11: Controller_Sheet (U2.25), Button_Sheet (C33.2 R26.2 SW11.2)
SW#12: Controller_Sheet (U2.30), Button_Sheet (C34.2 R27.2 SW12.2)
SW#13: Controller_Sheet (U2.24), Button_Sheet (C35.2 R28.2 SW13.2)
SW#14: Controller_Sheet (U2.17), Button_Sheet (C36.2 R23.2 SW14.2)
SW#15: Controller_Sheet (U2.20), Button_Sheet (C37.2 R21.2 SW15.2)
SW#16: Controller_Sheet (U2.23), Button_Sheet (C38.2 R24.2 SW16.2)
SW#17: Controller_Sheet (U2.29), Button_Sheet (C39.2 R22.2 SW17.2)
SW#18: Controller_Sheet (U2.27), Button_Sheet (C40.2 R29.2 SW18.2)
SW#19: Controller_Sheet (U2.26), Button_Sheet (C41.2 R30.2 SW19.2)
SW#20: Controller_Sheet (U2.22), Button_Sheet (C42.2 R31.2 SW20.2)
SW#21: Controller_Sheet (U2.21), Button_Sheet (C43.2 R25.2 SW21.2)
USB_D_N: Power_Sheet (R4.2), Controller_Sheet (U2.44)
USB_D_P: Power_Sheet (R5.2), Controller_Sheet (U2.45)